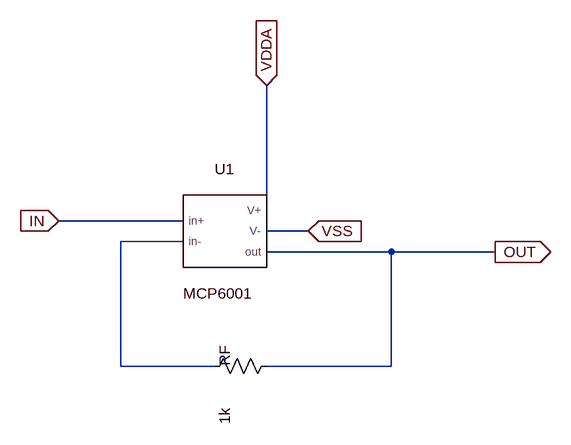
[diagram p0: schematic DAC_Buffer.asc]
DAC_Buffer.asc, the LTspice schematic file:
Version 4.1
SHEET 1 1152 768
WIRE 480 336 288 336
WIRE 480 368 384 368
WIRE 384 368 384 560
WIRE 384 560 528 560
WIRE 608 384 800 384
WIRE 800 384 960 384
WIRE 800 384 800 560
WIRE 608 560 800 560
WIRE 608 320 608 128
WIRE 608 352 672 352
FLAG 288 336 IN
IOPIN 288 336 In
FLAG 960 384 OUT
IOPIN 960 384 Out
FLAG 608 128 VDDA
IOPIN 608 128 In
FLAG 672 352 VSS
IOPIN 672 352 In
SYMBOL MCP6001 544 352 R0
WINDOW 0 -16 -96 Left 2
WINDOW 3 -64 96 Left 2
SYMATTR InstName U1
SYMATTR Value MCP6001
SYMBOL res 624 544 R90
WINDOW 0 -16 80 Left 2
WINDOW 3 80 80 Left 2
SYMATTR InstName RF
SYMATTR Value 1k

The netlist it stands for:
* DAC_Buffer.asc
X§U1 IN N001 VDDA VSS OUT MCP6001  ; pins in+ in- V+ V- out
RF OUT N001 1k
.lib MCP6001.txt
.backanno
.end